# Altium project MVP-Dash-v1.0.PrjPcb (part 2 of 15)

## Sheet Power-PMIC-Sheet.SchDoc
size 420 x 297 mm; SheetNumber: 2; SheetTotal: 25
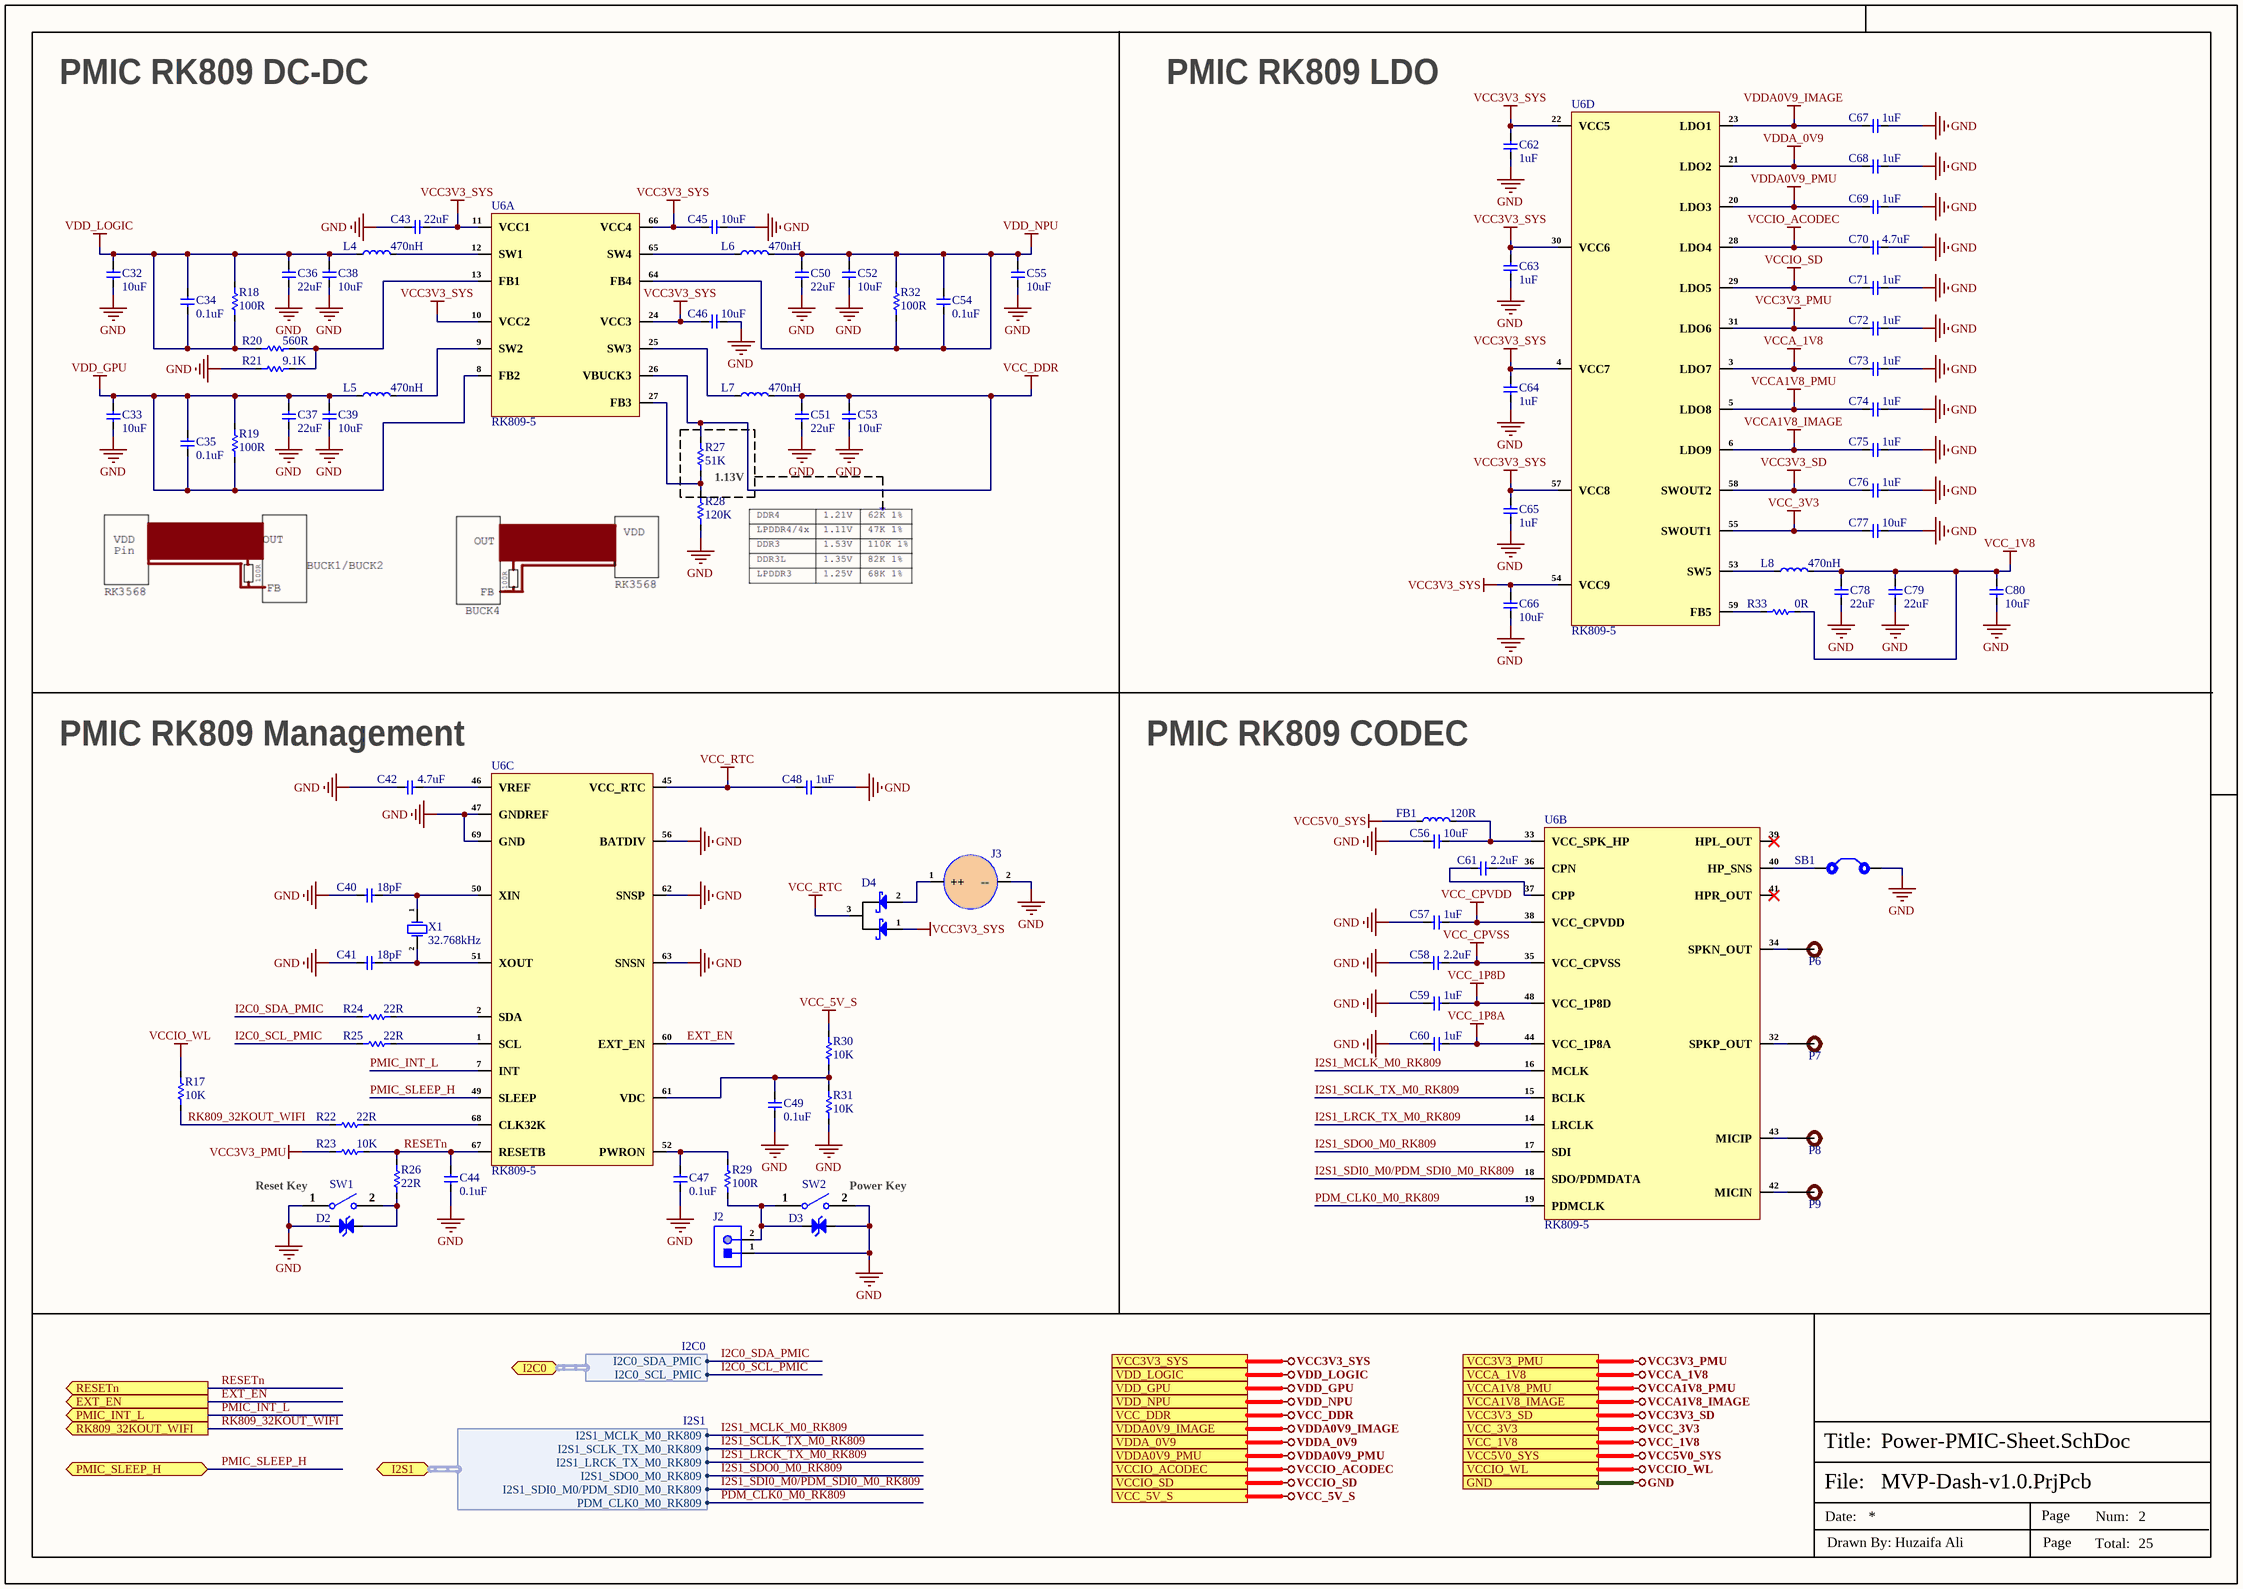
[diagram p1: Power-PMIC-Sheet.SchDoc]

### Parts
C32  10uF  [Cap-0603]
C33  10uF  [Cap-0603]
C34  0.1uF  [Cap-0402]
C35  0.1uF  [Cap-0402]
C36  22uF  [Cap-0603]
C37  22uF  [Cap-0603]
C38  10uF  [Cap-0603]
C39  10uF  [Cap-0603]
C40  18pF  [Cap-0402]
C41  18pF  [Cap-0402]
C42  4.7uF  [Cap-0402]
C43  22uF  [Cap-0603]
C44  0.1uF  [Cap-0402]
C45  10uF  [Cap-0603]
C46  10uF  [Cap-0603]
C47  0.1uF  [Cap-0402]
C48  1uF  [Cap-0402]
C49  0.1uF  [Cap-0402]
C50  22uF  [Cap-0603]
C51  22uF  [Cap-0603]
C52  10uF  [Cap-0603]
C53  10uF  [Cap-0603]
C54  0.1uF  [Cap-0402]
C55  10uF  [Cap-0603]
C56  10uF  [Cap-0603]
C57  1uF  [Cap-0402]
C58  2.2uF  [Cap-0402]
C59  1uF  [Cap-0402]
C60  1uF  [Cap-0402]
C61  2.2uF  [Cap-0402]
C62  1uF  [Cap-0402]
C63  1uF  [Cap-0402]
C64  1uF  [Cap-0402]
C65  1uF  [Cap-0402]
C66  10uF  [Cap-0603]
C67  1uF  [Cap-0402]
C68  1uF  [Cap-0402]
C69  1uF  [Cap-0402]
C70  4.7uF  [Cap-0402]
C71  1uF  [Cap-0402]
C72  1uF  [Cap-0402]
C73  1uF  [Cap-0402]
C74  1uF  [Cap-0402]
C75  1uF  [Cap-0402]
C76  1uF  [Cap-0402]
C77  10uF  [Cap-0603]
C78  22uF  [Cap-0603]
C79  22uF  [Cap-0603]
C80  10uF  [Cap-0603]
D2  ESD5451N  [DFN1006-2L (Bi-Directional)]  (value not drawn)
D3  ESD5451N  [DFN1006-2L (Bi-Directional)]  (value not drawn)
D4  BAT54C  [SOT-23]  (value not drawn)
FB1  120R  [IND-0603 (1608 Metric)]
J2  X6511WV-02H-C60D30  [HDR1X2_]  (value not drawn)
J3  CR2032-BS-6-1  [CR2032-BS-6-1]  (value not drawn)
L4  470nH  [YHNR3012-R47M]
L5  470nH  [YHNR3012-R47M]
L6  470nH  [YHNR3012-R47M]
L7  470nH  [YHNR3012-R47M]
L8  470nH  [YHNR3012-R47M]
P6  TEST POINT 0.5mm Dia  [Test-point - 0.5mm]  (value not drawn)  (no BOM)
P7  TEST POINT 0.5mm Dia  [Test-point - 0.5mm]  (value not drawn)  (no BOM)
P8  TEST POINT 0.5mm Dia  [Test-point - 0.5mm]  (value not drawn)  (no BOM)
P9  TEST POINT 0.5mm Dia  [Test-point - 0.5mm]  (value not drawn)  (no BOM)
R17  10K  [Res-0402]
R18  100R  [Res-0402]
R19  100R  [Res-0402]
R20  560R  [Res-0402]
R21  9.1K  [Res-0402]
R22  22R  [Res-0402]
R23  10K  [Res-0402]
R24  22R  [Res-0402]
R25  22R  [Res-0402]
R26  22R  [Res-0402]
R27  51K  [Res-0402]
R28  120K  [Res-0402]
R29  100R  [Res-0402]
R30  10K  [Res-0402]
R31  10K  [Res-0402]
R32  100R  [Res-0402]
R33  0R  [Res-0402]
SB1  Solder Bridge 0402  [Solder Bridge 0402]  (value not drawn)  (no BOM)
SW1  B3U-1000P  [B3U-1000P]  (value not drawn)
SW2  B3U-1000P  [B3U-1000P]  (value not drawn)
U6  RK809-5  [68-QFN-(7x7)]  (parts A,B,C,D of 4)
X1  32.768kHz  [SMD3215-2P]

### Blocks framed on the sheet
1.13V: R27

### Ports
EXT_EN (out, see Power-DC-IN-Sheet[1D]), GND (see CAN-Bus-SPI-Flash-Sheet[4D], Connector-Sheet[5D], DRAM-LPDDR4x-Sheet[4D], eMMC-Sheet[4D], LED-Debug-Sheet[4D], Power-DC-IN-Sheet[4D], Power-Others-Sheet[4D], RK3568-Audio-Interface[4D], RK3568-Flash-SD-Controller[4D], RK3568-OSC-PMUIO-Sheet[5D], RK3568-Power-Sheet[4D], RK3568-SARADC-GPIO[4D], RK3568-USB-PCIe-Sheet[5D], RK3568-VI-Interface-Sheet[4D], RK3568-VO-Interface-1[4D], RK3568-VO-Interface-2[4D], Sensors-Sheet-1[4D], Sensors-Sheet-2[5D], Type-C-Sheet[4D], USB-Ports[4D], VO-HDMI2.0-TX-Sheet[4D], VO-LCM-MIPI-DSI-TX0[4D], WIFI-BT-SDIO-Sheet[4D]), I2C0 (bidir, harness I2C0, see Power-Others-Sheet[3D], RK3568-OSC-PMUIO-Sheet[3D], Type-C-Sheet[2D]), I2S1 (bidir, harness I2S1, see RK3568-Audio-Interface[1D]), PMIC_INT_L (out, see RK3568-OSC-PMUIO-Sheet[5B]), PMIC_SLEEP_H (bidir, see Power-Others-Sheet[1D], RK3568-OSC-PMUIO-Sheet[5B]), RESETn (out, see RK3568-OSC-PMUIO-Sheet[5A]), RK809_32KOUT_WIFI (out, see WIFI-BT-SDIO-Sheet[3D]), VCC3V3_PMU (see Power-Others-Sheet[4D], RK3568-OSC-PMUIO-Sheet[5D], Type-C-Sheet[4D]), VCC3V3_SD (see CAN-Bus-SPI-Flash-Sheet[4D]), VCC3V3_SYS (see DRAM-LPDDR4x-Sheet[4D], Power-DC-IN-Sheet[4D], RK3568-SARADC-GPIO[4D]), VCC5V0_SYS (see Power-DC-IN-Sheet[4D], Power-Others-Sheet[4D], Sensors-Sheet-1[4D], VO-HDMI2.0-TX-Sheet[4D], VO-LCM-MIPI-DSI-TX0[4D]), VCC_1V8 (see Power-Others-Sheet[4D], RK3568-SARADC-GPIO[4D], RK3568-VI-Interface-Sheet[4D], WIFI-BT-SDIO-Sheet[4D]), VCC_3V3 (see eMMC-Sheet[4D], RK3568-SARADC-GPIO[4D], RK3568-USB-PCIe-Sheet[5D], RK3568-VO-Interface-2[4D], VO-HDMI2.0-TX-Sheet[4D], WIFI-BT-SDIO-Sheet[4D]), VCC_5V_S (see Power-DC-IN-Sheet[4D]), VCC_DDR (see DRAM-LPDDR4x-Sheet[4D]), VCCA1V8_IMAGE (see RK3568-VI-Interface-Sheet[4D], RK3568-VO-Interface-1[4D]), VCCA1V8_PMU (see DRAM-LPDDR4x-Sheet[4D], RK3568-OSC-PMUIO-Sheet[5D]), VCCA_1V8 (see LED-Debug-Sheet[4D], RK3568-OSC-PMUIO-Sheet[5D], RK3568-SARADC-GPIO[4D], RK3568-USB-PCIe-Sheet[5D]), VCCIO_ACODEC, VCCIO_SD (see RK3568-Flash-SD-Controller[4D]), VCCIO_WL, VDD_GPU (see RK3568-Power-Sheet[4D]), VDD_LOGIC (see RK3568-Power-Sheet[4D]), VDD_NPU (see RK3568-Power-Sheet[4D]), VDDA0V9_IMAGE (see RK3568-VI-Interface-Sheet[4D], RK3568-VO-Interface-1[4D]), VDDA0V9_PMU (see RK3568-OSC-PMUIO-Sheet[5D]), VDDA_0V9 (see RK3568-OSC-PMUIO-Sheet[5D], RK3568-USB-PCIe-Sheet[5D])

### Harnesses
I2S1: I2S1_MCLK_M0_RK809, I2S1_SCLK_TX_M0_RK809, I2S1_LRCK_TX_M0_RK809, I2S1_SDO0_M0_RK809, I2S1_SDI0_M0/PDM_SDI0_M0_RK809, PDM_CLK0_M0_RK809
I2C0: I2C0_SDA_PMIC, I2C0_SCL_PMIC

### Nets
GND: C32.1 C33.1 C36.1 C37.1 C38.1 C39.1 C40.1 C41.1 C42.1 C43.2 C44.1 C45.1 C46.1 C47.1 C48.1 C49.1 C50.1 C51.1 C52.1 C53.1 C55.1 C56.2 C57.2 C58.1 C59.2 C60.2 C62.1 C63.1 C64.1 C65.1 C66.1 C67.1 C68.1 C69.1 C70.1 C71.1 C72.1 C73.1 C74.1 C75.1 C76.1 C77.1 C78.1 C79.1 C80.1 D2.1(K) D3.2(K) J2.1 J3.2(--) R21.1 R28.1 R31.1 SB1.2 SW1.1 SW2.2 U6.47(GNDREF) U6.56(BATDIV) U6.62(SNSP) U6.63(SNSN) U6.69(GND) ; port GND
VCC3V3_PMU: C72.2 R23.2 U6.31(LDO6) ; port VCC3V3_PMU
VCC3V3_SD: C76.2 U6.58(SWOUT2) ; port VCC3V3_SD
VCC3V3_SYS: C43.1 C45.2 C46.2 C62.2 C63.2 C64.2 C65.2 C66.2 D4.1(A) U6.4(VCC7) U6.10(VCC2) U6.11(VCC1) U6.22(VCC5) U6.24(VCC3) U6.30(VCC6) U6.54(VCC9) U6.57(VCC8) U6.66(VCC4) ; port VCC3V3_SYS
VCC5V0_SYS: FB1.1 ; port VCC5V0_SYS
VCC_1P8A: C60.1 U6.44(VCC_1P8A)
VCC_1P8D: C59.1 U6.48(VCC_1P8D)
VCC_1V8: C78.2 C79.2 C80.2 L8.2 R33.2 ; port VCC_1V8
VCC_3V3: C77.2 U6.55(SWOUT1) ; port VCC_3V3
VCC_5V_S: R30.2 ; port VCC_5V_S
VCC_CPVDD: C57.1 U6.38(VCC_CPVDD)
VCC_CPVSS: C58.2 U6.35(VCC_CPVSS)
VCC_DDR: C51.2 C53.2 L7.2 R27.2 U6.26(VBUCK3) ; port VCC_DDR
VCC_RTC: C48.2 D4.3(K) U6.45(VCC_RTC)
VCCA1V8_IMAGE: C75.2 U6.6(LDO9) ; port VCCA1V8_IMAGE
VCCA1V8_PMU: C74.2 U6.5(LDO8) ; port VCCA1V8_PMU
VCCA_1V8: C73.2 U6.3(LDO7) ; port VCCA_1V8
VCCIO_ACODEC: C70.2 U6.28(LDO4) ; port VCCIO_ACODEC
VCCIO_SD: C71.2 U6.29(LDO5) ; port VCCIO_SD
VCCIO_WL: R17.1 ; port VCCIO_WL
VDD_GPU: C33.2 C35.1 C35.2 C37.2 C39.2 L5.1 R19.1 R19.2 U6.8(FB2) ; port VDD_GPU
VDD_LOGIC: C32.2 C34.1 C34.2 C36.2 C38.2 L4.1 R18.1 R18.2 R20.1 ; port VDD_LOGIC
VDD_NPU: C50.2 C52.2 C54.1 C54.2 C55.2 L6.2 R32.1 R32.2 U6.64(FB4) ; port VDD_NPU
VDDA0V9_IMAGE: C67.2 U6.23(LDO1) ; port VDDA0V9_IMAGE
VDDA0V9_PMU: C69.2 U6.20(LDO3) ; port VDDA0V9_PMU
VDDA_0V9: C68.2 U6.21(LDO2) ; port VDDA_0V9
EXT_EN: U6.60(EXT_EN) ; port EXT_EN
I2C0_SCL_PMIC: R25.2 ; port I2C0.I2C0_SCL_PMIC
I2C0_SDA_PMIC: R24.2 ; port I2C0.I2C0_SDA_PMIC
I2S1_LRCK_TX_M0_RK809: U6.14(LRCLK) ; port I2S1.I2S1_LRCK_TX_M0_RK809
I2S1_MCLK_M0_RK809: U6.16(MCLK) ; port I2S1.I2S1_MCLK_M0_RK809
I2S1_SCLK_TX_M0_RK809: U6.15(BCLK) ; port I2S1.I2S1_SCLK_TX_M0_RK809
I2S1_SDI0_M0/PDM_SDI0_M0_RK809: U6.18(SDO/PDMDATA) ; port I2S1.I2S1_SDI0_M0/PDM_SDI0_M0_RK809
I2S1_SDO0_M0_RK809: U6.17(SDI) ; port I2S1.I2S1_SDO0_M0_RK809
PDM_CLK0_M0_RK809: U6.19(PDMCLK) ; port I2S1.PDM_CLK0_M0_RK809
PMIC_INT_L: U6.7(INT) ; port PMIC_INT_L
PMIC_SLEEP_H: U6.49(SLEEP) ; port PMIC_SLEEP_H
RESETn: C44.2 R23.1 R26.2 U6.67(RESETB) ; port RESETn
RK809_32KOUT_WIFI: R17.2 R22.2 ; port RK809_32KOUT_WIFI
NetC40_2: C40.2 U6.50(XIN) X1.1(OSC1)
NetC41_2: C41.2 U6.51(XOUT) X1.2(OSC2)
NetC42_2: C42.2 U6.46(VREF)
NetC47_2: C47.2 R29.2 U6.52(PWRON)
NetC49_2: C49.2 R30.1 R31.2 U6.61(VDC)
NetC56_1: C56.1 FB1.2 U6.33(VCC_SPK_HP)
NetC61_1: C61.1 U6.37(CPP)
NetC61_2: C61.2 U6.36(CPN)
NetD2_2: D2.2(K) R26.1 SW1.2
NetD3_1: D3.1(K) J2.2 R29.1 SW2.1
NetD4_2: D4.2(A) J3.1(++)
NetL4_2: L4.2 U6.12(SW1)
NetL5_2: L5.2 U6.9(SW2)
NetL6_1: L6.1 U6.65(SW4)
NetL7_1: L7.1 U6.25(SW3)
NetL8_1: L8.1 U6.53(SW5)
NetP6_1: P6.1 U6.34(SPKN_OUT)
NetP7_1: P7.1 U6.32(SPKP_OUT)
NetP8_1: P8.1 U6.43(MICIP)
NetP9_1: P9.1 U6.42(MICIN)
NetR20_2: R20.2 R21.2 U6.13(FB1)
NetR22_1: R22.1 U6.68(CLK32K)
NetR24_1: R24.1 U6.2(SDA)
NetR25_1: R25.1 U6.1(SCL)
NetR27_1: R27.1 R28.2 U6.27(FB3)
NetR33_1: R33.1 U6.59(FB5)
NetSB1_1: SB1.1 U6.40(HP_SNS)

Not connected (* = marked no-connect by the designer): U6 39(HPL_OUT)* 41(HPR_OUT)*

### Notes on the sheet
- PMIC RK809 DC-DC
- PMIC RK809 LDO
- (near C42) PMIC RK809 Management
- PMIC RK809 CODEC
- Reset Key
- (near SW2) Power Key
- File:
- Title:
- Date:
- Page
- Num:
- Total:
- Drawn By: Huzaifa Ali

### Library data of the parts
C32 C33 C38 C39 C45 C46 C52 C53 C55 C56 C66 C77 C80 = CC0603KRX5R6BB106: CAP CER 10UF 10V X5R 0603; Manufacturer: Yageo; Tolerance: 10%; Item Type: Capacitor; Supplier 1: Digi-Key; Manufacturer Part Number: CC0603KRX5R6BB106; RoHS: Yes; Category: Ceramic Capacitors; Stock 1: 187515; Pricing 1: 1=0.24000, 10=0.16300, 50=0.09780, 100=0.08260, 500=0.05654, 1000=0.05001 (USD); Mount: Surface Mount; Case/Package: 0603; Case Code (Metric): 1608; Case Code (Imperial): 0603; Weight: 7.1E-05oz; Min Operating Temperature: -55°C; Max Operating Temperature: 85°C; Capacitance: 10uF; Packaging: Tape and Reel; Dielectric: X5R; Voltage Rating: 10V; Termination: SMD/SMT; Resistor Type: Ceramic; Voltage Rating (DC): 10V; Package Quantity: 4000; Length: 0.063inch; Width: 0.031inch; Thickness: 0.035inch; Depth: 0.8mm; Lead Free: Lead Free; Halogen Free: Halogen Free; RoHS Compliant: Yes; ComponentLink1URL: http://www.mouser.com/ds/2/447/Yageo_UPY-GP_NP0_16V-to-50V_9-358835.pdf?src-supplier=Mouser; ComponentLink1Description: http://www.mouser.com/ds/2/447/Yageo_UPY-GP_NP0_16V-to-50V_9-358835.pdf?src-supplier=Mouser; ComponentLink2URL: http://www.yageo.com/documents/recent/UPY-GPHC_X5R_4V-to-50V_25.pdf?src-supplier=Digi-Key; ComponentLink2Description: http://www.yageo.com/documents/recent/UPY-GPHC_X5R_4V-to-50V_25.pdf?src-supplier=Digi-Key; Supplier Part Number 1: 311-1782-1-ND; LCSC Part Number: C326057
C34 C35 C44 C47 C49 C54 = CC0402KRX5R6BB104: CAP CER 0.1UF 10V X5R 0402; Manufacturer: Yageo; Capacitance: 100nF; Tolerance: 10%; Dissipation Factor: 5%; Insulation Resistance: 10GR; Item Type: Capacitor; Supplier 1: Digi-Key; Manufacturer Part Number: CC0402KRX5R6BB104; RoHS: Yes; Category: Ceramic Capacitors; Stock 1: 6385580; Pricing 1: 1=0.10000, 10=0.02700, 50=0.01500, 100=0.01220, 500=0.00874, 1000=0.00687, 2500=0.00625, 5000=0.00575 (USD); Mount: Surface Mount; Case/Package: 0402; Number of Pins: 2; Case Code (Imperial): 0402; Case Code (Metric): 1005; Min Operating Temperature: -55°C; Max Operating Temperature: 85°C; Dielectric: X5R; Packaging: Tape and Reel; Voltage Rating: 10V; Package Quantity: 1; Termination: SMD/SMT; Voltage Rating (DC): 10V; Series: CC; Length: 1mm; Width: 0.02inch; Height: 0.5mm; Depth: 0.5mm; Thickness: 0.022inch; Radiation Hardening: No; RoHS Compliant: Yes; REACH SVHC: No SVHC; Lead Free: Lead Free; Halogen Free: Halogen Free; ComponentLink1URL: https://datasheet.ciiva.com/144/mlccorderingcode-144029.pdf?src-supplier=Digi-Key; ComponentLink1Description: https://datasheet.ciiva.com/144/mlccorderingcode-144029.pdf?src-supplier=Digi-Key; ComponentLink2URL: https://datasheet.ciiva.com/144/mlccorderingcode-144028.pdf?src-supplier=Digi-Key; ComponentLink2Description: https://datasheet.ciiva.com/144/mlccorderingcode-144028.pdf?src-supplier=Digi-Key; ComponentLink3URL: https://datasheet.ciiva.com/144/mlccorderingcode-144030.pdf?src-supplier=Digi-Key; ComponentLink3Description: https://datasheet.ciiva.com/144/mlccorderingcode-144030.pdf?src-supplier=Digi-Key; ComponentLink4URL: https://datasheet.ciiva.com/7978/1359354-7978091.pdf?src-supplier=Element14; ComponentLink4Description: https://datasheet.ciiva.com/7978/1359354-7978091.pdf?src-supplier=Element14; ComponentLink5URL: https://datasheet.ciiva.com/11587/upy-gphc-x5r-4v-to-50v-12-11587302.pdf?src-supplier=Avnet; ComponentLink5Description: https://datasheet.ciiva.com/11587/upy-gphc-x5r-4v-to-50v-12-11587302.pdf?src-supplier=Avnet; Supplier Part Number 1: 311-1336-1-ND; LCSC Part Number: C129131
C36 C37 C50 C51 C78 C79 = CC0603MRX5R5BB226: CAP CER 22UF 6.3V X5R 0603; Manufacturer: Yageo; Tolerance: 20%; Supplier 1: Mouser; Manufacturer Part Number: CC0603MRX5R5BB226; RoHS: Yes; Category: Ceramic Capacitors; Stock 1: 3030; Pricing 1: 1=0.33000, 10=0.22500, 50=0.22500, 100=0.12800, 1000=0.07900, 10000=0.06500 (USD); Mount: Surface Mount; Case/Package: 0603; Case Code (Metric): 1608; Case Code (Imperial): 0603; Weight: 7.1E-05oz; Min Operating Temperature: -55°C; Max Operating Temperature: 85°C; Capacitance: 22uF; Packaging: Tape and Reel; Dielectric: X5R; Voltage Rating: 6.3V; Termination: SMD/SMT; Resistor Type: Ceramic; Voltage Rating (DC): 6.3V; Package Quantity: 4000; Length: 0.063inch; Width: 0.031inch; Thickness: 0.035inch; Depth: 0.8mm; Lead Free: Lead Free; Halogen Free: Halogen Free; RoHS Compliant: Yes; ComponentLink1URL: http://www.mouser.com/ds/2/447/Yageo_UPY-GP_NP0_16V-to-50V_9-358835.pdf?src-supplier=Mouser; ComponentLink1Description: http://www.mouser.com/ds/2/447/Yageo_UPY-GP_NP0_16V-to-50V_9-358835.pdf?src-supplier=Mouser; ComponentLink2URL: http://www.yageo.com/documents/recent/UPY-GPHC_X5R_4V-to-50V_25.pdf?src-supplier=Digi-Key; ComponentLink2Description: http://www.yageo.com/documents/recent/UPY-GPHC_X5R_4V-to-50V_25.pdf?src-supplier=Digi-Key; Supplier Part Number 1: 603-CC603MRX5R5BB226; LCSC Part Number: C109448
C40 C41 = GCM1555C1H180GA16D: CAP CER 18PF 50V C0G/NP0 0402; Manufacturer: Murata; Tolerance: 2%; Item Type: Capacitor; Supplier: Rs; Supplier Part Number: 2477793P; Manufacturer Part Number: GCM1555C1H180GA16D; RoHS: Yes; Category: Ceramic Capacitors; Stock: 10000; Pricing: 500=0.013, 5000=0.009 (GBP); Mounting Technology: Surface Mount; Case/Package: 0402; Case Code (Imperial): 0402; Case Code (Metric): 1005; Min Operating Temperature: -55°C; Max Operating Temperature: 125°C; Packaging: Cut Tape; Value: 18pF; Voltage Rating: 50V; Series: GCM; Ratings: AEC-Q200; RoHS Compliant: Yes; ComponentLink1URL: http://search.murata.co.jp/Ceramy/image/img/A01X/G101/ENG/GCM1555C1H180GA16-01.pdf?src-supplier=Digi-Key; ComponentLink1Description: http://search.murata.co.jp/Ceramy/image/img/A01X/G101/ENG/GCM1555C1H180GA16-01.pdf?src-supplier=Digi-Key; ComponentLink2URL: https://search.murata.co.jp/Ceramy/image/img/A01X/G101/ENG/GCM1555C1H180GA16-01.pdf?src-supplier=Digi-Key; ComponentLink2Description: https://search.murata.co.jp/Ceramy/image/img/A01X/G101/ENG/GCM1555C1H180GA16-01.pdf?src-supplier=Digi-Key; ComponentLink3URL: https://datasheet.octopart.com/GCM1555C1H180GA16D-Murata-datasheet-149522315.pdf?src-supplier=Newark; ComponentLink3Description: https://datasheet.octopart.com/GCM1555C1H180GA16D-Murata-datasheet-149522315.pdf?src-supplier=Newark; ComponentLink4URL: https://datasheet.octopart.com/GCM1555C1H180GA16D-Murata-datasheet-12511495.pdf?src-supplier=TME; ComponentLink4Description: https://datasheet.octopart.com/GCM1555C1H180GA16D-Murata-datasheet-12511495.pdf?src-supplier=TME; LCSC Part Number: C882583
C42 = CC0402KRX5R6BB475: CAP CER 4.7UF 10V X5R 0402; Manufacturer: Yageo; Tolerance: 10%; Supplier 1: Farnell; Manufacturer Part Number: CC0402KRX5R6BB475; RoHS: Yes; Category: Ceramic Capacitors; Stock 1: 20000; Pricing 1: 10000=0.02310, 50000=0.02100 (GBP); Mount: Surface Mount; Case/Package: 0402; Case Code (Imperial): 0402; Case Code (Metric): 1005; Min Operating Temperature: -55°C; Max Operating Temperature: 85°C; Packaging: Cut Tape; Capacitance: 4.7uF; Voltage Rating: 10V; RoHS Compliant: Yes; ComponentLink1URL: http://www.yageo.com/documents/recent/UPY-GPHC_X5R_4V-to-50V_25.pdf?src-supplier=Digi-Key; ComponentLink1Description: http://www.yageo.com/documents/recent/UPY-GPHC_X5R_4V-to-50V_25.pdf?src-supplier=Digi-Key; Supplier Part Number 1: 3871698; LCSC Part Number: C326586
C43 = CC0603MRX5R6BB226: CAP CER 22UF 10V X5R 0603; Manufacturer: Yageo; Tolerance: 20%; Item Type: Capacitor; Supplier 1: Digi-Key; Manufacturer Part Number: CC0603MRX5R6BB226; RoHS: Yes; Category: Ceramic Capacitors; Stock 1: 19628; Pricing 1: 1=0.68000, 10=0.48000, 50=0.36300, 100=0.31610, 500=0.23416, 1000=0.19903 (USD); Mount: Surface Mount; Case/Package: 0603; Case Code (Metric): 1608; Case Code (Imperial): 0603; Weight: 7.1E-05oz; Min Operating Temperature: -55°C; Max Operating Temperature: 85°C; Packaging: Tape and Reel; Capacitance: 22uF; Voltage Rating: 10V; Dielectric: X5R; Termination: SMD/SMT; Voltage Rating (DC): 10V; Package Quantity: 4000; Length: 0.063inch; Width: 0.8mm; Height: 0.8mm; Thickness: 0.035inch; Lead Free: Lead Free; Halogen Free: Halogen Free; RoHS Compliant: Yes; ComponentLink1URL: http://www.mouser.com/ds/2/447/Yageo_UPY-GP_NP0_16V-to-50V_9-358835.pdf?src-supplier=Mouser; ComponentLink1Description: http://www.mouser.com/ds/2/447/Yageo_UPY-GP_NP0_16V-to-50V_9-358835.pdf?src-supplier=Mouser; ComponentLink2URL: http://www.yageo.com/documents/recent/UPY-GPHC_X5R_4V-to-50V_25.pdf?src-supplier=Digi-Key; ComponentLink2Description: http://www.yageo.com/documents/recent/UPY-GPHC_X5R_4V-to-50V_25.pdf?src-supplier=Digi-Key; Supplier Part Number 1: 311-1819-1-ND; LCSC Part Number: C109447
C48 C57 C59 C60 C62-C65 C67-C69 C71-C76 = CC0402KRX5R6BB105: CAP CER 1UF 10V X5R 0402; Manufacturer: Yageo; Tolerance: 10%; Dissipation Factor: 15%; Item Type: Capacitor; Supplier 1: Mouser; Manufacturer Part Number: CC0402KRX5R6BB105; RoHS: Yes; Category: Ceramic Capacitors; Stock 1: 6711367; Pricing 1: 1=0.11000, 10=0.05500, 50=0.05500, 100=0.03300, 500=0.02700, 1000=0.02200, 2500=0.02100, 10000=0.01800 (USD); Mount: Surface Mount; Case/Package: 0402; Number of Pins: 2; Case Code (Metric): 1005; Case Code (Imperial): 0402; Min Operating Temperature: -55°C; Max Operating Temperature: 85°C; Capacitance: 1uF; Dielectric: X5R; Package Quantity: 1; Voltage Rating: 10V; Packaging: Tape and Reel; Voltage Rating (DC): 10V; Termination: SMD/SMT; Resistor Type: Ceramic; Series: CC; Construction: Flat; Length: 1mm; Width: 0.02inch; Height: 0.5mm; Thickness: 0.022inch; Depth: 0.5mm; Radiation Hardening: No; REACH SVHC: No SVHC; Lead Free: Lead Free; Halogen Free: Halogen Free; RoHS Compliant: Yes; ComponentLink1URL: https://datasheet.ciiva.com/176/upy-gphc-x5r-4v-to-50v-12-176704.pdf?src-supplier=Digi-Key; ComponentLink1Description: https://datasheet.ciiva.com/176/upy-gphc-x5r-4v-to-50v-12-176704.pdf?src-supplier=Digi-Key; ComponentLink2URL: https://datasheet.ciiva.com/176/mlccorderingcode-176705.pdf?src-supplier=Digi-Key; ComponentLink2Description: https://datasheet.ciiva.com/176/mlccorderingcode-176705.pdf?src-supplier=Digi-Key; ComponentLink3URL: https://datasheet.ciiva.com/176/mlccorderingcode-176706.pdf?src-supplier=Digi-Key; ComponentLink3Description: https://datasheet.ciiva.com/176/mlccorderingcode-176706.pdf?src-supplier=Digi-Key; Supplier Part Number 1: 603-CC402KRX5R6BB105; LCSC Part Number: C106254
C58 C61 = C1005X5R0J225KTJA0E: CAP CER 2.2UF 6.3V X5R 0402; Manufacturer: TDK; Item Type: Capacitor; LCSC Part Number: C343036; Manufacturer Part Number: C1005X5R0J225KTJA0E; ComponentLink1Description: LCSC; ComponentLink1URL: https://www.lcsc.com/product-detail/Multilayer-Ceramic-Capacitors-MLCC-SMD-SMT_TDK-C1005X5R0J225KTJA0E_C343036.html
C70 = CC0402KRX5R5BB475: CAP CER 4.7UF 6.3V X5R 0402; Manufacturer: Yageo; Tolerance: 10%; Item Type: Capacitor; Supplier 1: Arrow Electronics; Manufacturer Part Number: CC0402KRX5R5BB475; RoHS: Yes; Category: Ceramic Capacitors; Stock 1: 890000; Pricing 1: 10000=0.02120, 20000=0.02030, 30000=0.02010, 50000=0.01930, 100000=0.01760, 250000=0.01630 (USD); Case/Package: 0402; Voltage Rating (DC): 6.3V; Dielectric: X5R; Capacitance: 4.7uF; Lead Free: Lead Free; Halogen Free: Halogen Free; RoHS Compliant: Yes; ComponentLink1URL: http://www.yageo.com/documents/recent/UPY-GPHC_X5R_4V-to-50V_25.pdf?src-supplier=Digi-Key; ComponentLink1Description: http://www.yageo.com/documents/recent/UPY-GPHC_X5R_4V-to-50V_25.pdf?src-supplier=Digi-Key; ComponentLink2URL: https://www.yageo.com/upload/media/product/productsearch/datasheet/mlcc/UPY-GPHC_X5R_4V-to-50V_26.pdf?src-supplier=Digi-Key; ComponentLink2Description: https://www.yageo.com/upload/media/product/productsearch/datasheet/mlcc/UPY-GPHC_X5R_4V-to-50V_26.pdf?src-supplier=Digi-Key; LCSC Part Number: C541466; Supplier Part Number 1: CC0402KRX5R5BB475
D2 D3 = ESD5451N: DFN1006-2(0402) ESD Protection Devices ROHS; Manufacturer: TECH PUBLIC; Manufacturer Part Number: ESD5451N; Footprint: DFN1006-2(0402); ComponentLink1Description: LCSC; ComponentLink1URL: https://www.lcsc.com/product-detail/span-style-background-color-ff0-ESD-span-Protection-Devices_TECH-PUBLIC-ESD5451N_C2936977.html; LCSC Part Number: C2936977
D4 = BAT54C: 30V Dual Common Cathode 1V@100mA 200mA SOT-23(TO-236) Schottky Barrier Diodes (SBD) ROHS; Manufacturer: Shandong Jingdao Microelectronics; Item Type: Diode; Manufacturer Part Number: BAT54C; LCSC Part Number: C2762215; ComponentLink1Description: LCSC; ComponentLink1URL: https://www.lcsc.com/product-detail/Schottky-Barrier-Diodes-SBD_Shandong-Jingdao-Microelectronics-BAT54C_C2762215.html; Package: SOT-23(TO-236)
FB1 = BLM18PG121SN1D: Ferrite Beads Multi-Layer 120Ohm 25% 100MHz 2A 50mOhm DCR 0603 Paper T/R; Manufacturer: Murata Electronics; Material: Steel,Ferrite; Number of Lines: 1; DC Resistance (DCR): 50mR; Shielding: Unshielded; Manufacturer Part Number: BLM18PG121SN1D; Package: 0603; LCSC Part Number: C14709; Item Type: Ferrite Bead; ComponentLink1Description: LCSC; ComponentLink1URL: https://www.lcsc.com/product-detail/Ferrite-Beads_Murata-Electronics-BLM18PG121SN1D_C14709.html; Supplier: Digikey; Supplier Part Number: 490-1037-1-ND; RoHS: Yes; Category: Ferrite Beads and Chips; Stock: 1240; Pricing: 1=0.1, 10=0.078, 25=0.0712, 50=0.064, 100=0.0469, 250=0.03412, 500=0.03128, 1000=0.02701 (USD); Case/Package: 0603; Pins: 2; Core Material: Ferrite; Case Code (Metric): 1608; Case Code (Imperial): 0603; Min Operating Temperature: -55°C; Max Operating Temperature: 125°C; Tolerance: 25%; Impedance: 120R; Package Quantity: 1; Max Current Rating: 2A; Packaging: Tape and Reel; Current Rating: 2A; Max DC Current: 2A; Termination: SMD/SMT; Test Frequency: 100MHz; DC Current: 2A; Frequency: 100MHz; Number of Circuits: 1; Series: BLM18P; DC Resistance-Max: 50mR; RMS Current (Irms): 2A; ESR: 50mR; Length: 1.6mm; Width: 0.8mm; Height: 0.8mm; Depth: 0.8mm; Radiation Hardening: No; Reach SVHC Compliant: No; Lead Free: Lead Free; RoHS Compliant: Yes; ComponentLink2URL: https://datasheet.ciiva.com/5709/1740433-5709171.pdf?src-supplier=Farnell; ComponentLink2Description: https://datasheet.ciiva.com/5709/1740433-5709171.pdf?src-supplier=Farnell; ComponentLink3URL: https://datasheet.ciiva.com/19454/1845013-19454715.pdf?src-supplier=Jameco; ComponentLink3Description: https://datasheet.ciiva.com/19454/1845013-19454715.pdf?src-supplier=Jameco; ComponentLink4URL: https://datasheet.ciiva.com/11799/0900766b81275ca5-11799546.pdf?src-supplier=Rs; ComponentLink4Description: https://datasheet.ciiva.com/11799/0900766b81275ca5-11799546.pdf?src-supplier=Rs; ComponentLink5URL: https://datasheet.ciiva.com/3854/5emiapbde-1-3854039.pdf?src-supplier=Arrow+Electronics; ComponentLink5Description: https://datasheet.ciiva.com/3854/5emiapbde-1-3854039.pdf?src-supplier=Arrow+Electronics; ComponentLink6URL: https://datasheet.ciiva.com/29347/442365-da-01-en-chip-drossel-0603-120r-2000ma-1-6x0-8mm-29347911.pdf?src-supplier=Conrad; ComponentLink6Description: https://datasheet.ciiva.com/29347/442365-da-01-en-chip-drossel-0603-120r-2000ma-1-6x0-8mm-29347911.pdf?src-supplier=Conrad; ComponentLink7URL: https://datasheet.ciiva.com/8021/1740433-8021493.pdf?src-supplier=Element14; ComponentLink7Description: https://datasheet.ciiva.com/8021/1740433-8021493.pdf?src-supplier=Element14; ComponentLink8URL: https://datasheet.ciiva.com/8021/1740433-8021494.pdf?src-supplier=Element14; ComponentLink8Description: https://datasheet.ciiva.com/8021/1740433-8021494.pdf?src-supplier=Element14; ComponentLink9URL: https://datasheet.ciiva.com/14122/blm-series-eng-tds-14122905.pdf?src-supplier=Distrelec; ComponentLink9Description: https://datasheet.ciiva.com/14122/blm-series-eng-tds-14122905.pdf?src-supplier=Distrelec; ComponentLink10URL: https://datasheet.ciiva.com/6212/l0110s0100blm18p-6212502.pdf?src-supplier=Digikey; ComponentLink10Description: https://datasheet.ciiva.com/6212/l0110s0100blm18p-6212502.pdf?src-supplier=Digikey; ComponentLink11URL: https://datasheet.ciiva.com/6212/l0110s0100blm18p-6212504.pdf?src-supplier=Digikey; ComponentLink11Description: https://datasheet.ciiva.com/6212/l0110s0100blm18p-6212504.pdf?src-supplier=Digikey; ComponentLink12URL: https://datasheet.ciiva.com/3081/l0110s0100blm18p-3081632.pdf?src-supplier=Avnet; ComponentLink12Description: https://datasheet.ciiva.com/3081/l0110s0100blm18p-3081632.pdf?src-supplier=Avnet; ComponentLink13URL: https://datasheet.ciiva.com/41449/001172297-da-01-en-drossel-0603-120r-1-6x0-8mm-4000st-41449659.pdf?src-supplier=Conrad; ComponentLink13Description: https://datasheet.ciiva.com/41449/001172297-da-01-en-drossel-0603-120r-1-6x0-8mm-4000st-41449659.pdf?src-supplier=Conrad
J2 = X6511WV-02H-C60D30: Gold 250V 3A Straight Square Pins 2.5mm 2P 260℃ 6mm -40℃~+105℃ 3mm 2.54mm Plugin Black Brass 1x2P Plugin,P=2.54mm Pin Headers ROHS; Manufacturer: XKB; Item Type: Male Header; Manufacturer Part Number: X6511WV-02H-C60D30; Package: Plugin,P=2.54mm; LCSC Part Number: C706874; ComponentLink1Description: LCSC; ComponentLink1URL: https://www.lcsc.com/product-detail/Pin-Headers_XKB-Connectivity-X6511WV-02H-C60D30_C706874.html
J3 = CR2032-BS-6-1: Battery base CR2032 SMD Battery Connectors ROHS; Manufacturer: Q&J; Manufacturer Part Number: CR2032-BS-6-1; LCSC Part Number: C70377; Item Type: Connector; ComponentLink1Description: LCSC; ComponentLink1URL: https://www.lcsc.com/product-detail/Battery-Connectors_Q-J-CR2032-BS-6-1_C70377.html
L4-L8 = YHNR3012-R47M: 4.2A 470nH 合金磁胶电感 ±20% 8A SMD,3x3mm Power Inductors ROHS; Manufacturer: YJYCOIN; Manufacturer Part Number: YHNR3012-R47M; Package: SMD,3x3mm; LCSC Part Number: C20416183; Item Type: Inductor; ComponentLink1Description: LCSC; ComponentLink1URL: https://www.lcsc.com/product-detail/Power-Inductors_YJYCOIN-YHNR3012-R47M_C20416183.html
P6-P9 = TEST POINT 0.5mm Dia: Test Point ON; Item Type: Test Point; Manufacturer Part Number: TEST POINT 0.5mm Dia
R17 R23 R30 R31 = RC0402FR-0710KL: RES 10K OHM 1% 1/16W 0402; Manufacturer: Yageo; Resistance: 10kR; Voltage Rating (DC): 50V; Temperature Coefficient: 100ppm/°C; Power Rating: 62.5mW; Max Power Dissipation: 63mW; Item Type: Resistor; Supplier 1: Mouser; Manufacturer Part Number: RC0402FR-0710KL; RoHS: Yes; Category: Chip SMD Resistors; Stock 1: 18648329; Pricing 1: 1=0.10000, 10=0.01400, 50=0.01400, 100=0.00500, 1000=0.00300, 10000=0.00200 (USD); Case/Package: 0402; Number of Pins: 2; Case Code (Imperial): 0402; Case Code (Metric): 1005; Min Operating Temperature: -55°C; Max Operating Temperature: 155°C; Resistor Type: Thick Film; Tolerance: 1%; Packaging: Tape and Reel; Voltage Rating: 50V; Termination: SMD/SMT; Working Voltage: 50V; Number of Terminations: 2; Features: Moisture Resistant; Series: RC; Resistance Tolerance: 1%; Construction: Rectangular; Length: 1mm; Width: 0.5mm; Height: 0.32mm; Depth: 0.5mm; Lead Pitch: 0.2mm; REACH SVHC: No SVHC; Lead Free: Lead Free; RoHS Compliant: Yes; Military Standard: Not; ComponentLink1URL: https://datasheet.ciiva.com/7660/38568-7660787.pdf?src-supplier=Element14; ComponentLink1Description: https://datasheet.ciiva.com/7660/38568-7660787.pdf?src-supplier=Element14; ComponentLink2URL: https://datasheet.ciiva.com/7849/1686128-7849814.pdf?src-supplier=Element14; ComponentLink2Description: https://datasheet.ciiva.com/7849/1686128-7849814.pdf?src-supplier=Element14; ComponentLink3URL: https://datasheet.ciiva.com/7983/1018594-7983486.pdf?src-supplier=Element14; ComponentLink3Description: https://datasheet.ciiva.com/7983/1018594-7983486.pdf?src-supplier=Element14; ComponentLink4URL: https://datasheet.ciiva.com/22747/1018594-22747512.pdf?src-supplier=Element14; ComponentLink4Description: https://datasheet.ciiva.com/22747/1018594-22747512.pdf?src-supplier=Element14; ComponentLink5URL: https://datasheet.ciiva.com/12667/pyu-rc0402-51-rohs-l-6-r-12667067.pdf?src-supplier=Mouser; ComponentLink5Description: https://datasheet.ciiva.com/12667/pyu-rc0402-51-rohs-l-6-r-12667067.pdf?src-supplier=Mouser; ComponentLink6URL: https://datasheet.ciiva.com/7849/1784430-7849813.pdf?src-supplier=Element14; ComponentLink6Description: https://datasheet.ciiva.com/7849/1784430-7849813.pdf?src-supplier=Element14; ComponentLink7URL: https://datasheet.ciiva.com/7849/1784430-7849815.pdf?src-supplier=Element14; ComponentLink7Description: https://datasheet.ciiva.com/7849/1784430-7849815.pdf?src-supplier=Element14; Supplier Part Number 1: 603-RC0402FR-0710KL; LCSC Part Number: C60490
R18 R19 R29 R32 = RC0402FR-07100RL: RES 100 OHM 1% 1/16W 0402; Manufacturer: Yageo; Power Rating: 62.5mW; Voltage Rating: 50V; Temperature Coefficient: 100ppm/°C; Max Power Dissipation: 63mW; Item Type: Resistor; Supplier 1: Mouser; Manufacturer Part Number: RC0402FR-07100RL; RoHS: Yes; Category: Chip SMD Resistors; Stock 1: 699545; Pricing 1: 1=0.10000, 10=0.01200, 50=0.01200, 100=0.00500, 1000=0.00300, 2500=0.00200, 10000=0.00100 (USD); Case/Package: 0402; Number of Pins: 2; Case Code (Imperial): 0402; Case Code (Metric): 1005; Size Code: 0402; Min Operating Temperature: -55°C; Max Operating Temperature: 155°C; Tolerance: 1%; Voltage Rating (DC): 50V; Resistance: 100R; Packaging: Tape and Reel; Termination: SMD/SMT; Resistor Type: Thick Film; Features: Moisture Resistant; Series: RC; Number of Terminations: 2; Resistance Tolerance: 1%; Construction: Rectangular; Technology: THICK FILM; Length: 1mm; Width: 0.5mm; Height: 0.32mm; Depth: 0.5mm; RoHS Compliant: Yes; REACH SVHC: No SVHC; Military Standard: Not; Lead Free: Lead Free; ComponentLink1URL: https://datasheet.ciiva.com/11808/0900766b80c66297-11808765.pdf?src-supplier=RSComponents; ComponentLink1Description: https://datasheet.ciiva.com/11808/0900766b80c66297-11808765.pdf?src-supplier=RSComponents; ComponentLink2URL: https://datasheet.ciiva.com/7849/1784430-7849810.pdf?src-supplier=Element14; ComponentLink2Description: https://datasheet.ciiva.com/7849/1784430-7849810.pdf?src-supplier=Element14; ComponentLink3URL: https://datasheet.ciiva.com/28367/1018594-28367226.pdf?src-supplier=Element14; ComponentLink3Description: https://datasheet.ciiva.com/28367/1018594-28367226.pdf?src-supplier=Element14; ComponentLink4URL: https://datasheet.ciiva.com/22747/1018594-22747511.pdf?src-supplier=Element14; ComponentLink4Description: https://datasheet.ciiva.com/22747/1018594-22747511.pdf?src-supplier=Element14; ComponentLink5URL: https://datasheet.ciiva.com/12667/pyu-rc0402-51-rohs-l-6-r-12667957.pdf?src-supplier=Mouser; ComponentLink5Description: https://datasheet.ciiva.com/12667/pyu-rc0402-51-rohs-l-6-r-12667957.pdf?src-supplier=Mouser; ComponentLink6URL: https://datasheet.ciiva.com/15189/getdatasheetpartid-329466-15189335.pdf?src-supplier=Verical; ComponentLink6Description: https://datasheet.ciiva.com/15189/getdatasheetpartid-329466-15189335.pdf?src-supplier=Verical; ComponentLink7URL: https://datasheet.ciiva.com/16740/pyu-rc0402-51-rohs-l-6-r-16740566.pdf?src-supplier=Future+Electronics; ComponentLink7Description: https://datasheet.ciiva.com/16740/pyu-rc0402-51-rohs-l-6-r-16740566.pdf?src-supplier=Future+Electronics; Supplier Part Number 1: 603-RC0402FR-07100RL; LCSC Part Number: C106232
R20 = RC0402FR-07560RL: RES 560 OHM 1% 1/16W 0402; Manufacturer: Yageo; Power Rating: 63mW; Temperature Coefficient: 100ppm/°C; Voltage Rating: 50V; Item Type: Resistor; Supplier: Future Electronics; Supplier Part Number: 8872046; Manufacturer Part Number: RC0402FR-07560RL; RoHS: Yes; Category: Chip SMD Resistors; Stock: 1360000; Pricing: 10000=0.0012, 100000=0.0011, 300000=0.0011, 1250000=0.001, 3000000=0.0009 (USD); Case/Package: 0402; Case Code (Metric): 1005; Case Code (Imperial): 0402; Min Operating Temperature: -55°C; Max Operating Temperature: 155°C; Tolerance: 1%; Packaging: Tape and Reel; Value: 560R; Package Quantity: 1; Resistor Type: Thick Film; Number of Terminations: 2; Termination: SMD/SMT; Max Power Dissipation: 63mW; Features: Moisture Resistant; Series: RC; Construction: Rectangular; Resistance Tolerance: 1%; Length: 1mm; Width: 0.02inch; Height: 0.016inch; Depth: 0.5mm; RoHS Compliant: Yes; Military Standard: Not; Lead Free: Lead Free; Reach SVHC Compliant: Unknown; ComponentLink1URL: https://datasheet.ciiva.com/2453/pyu-r-int-thick-7-2453458.pdf?src-supplier=Digikey; ComponentLink1Description: https://datasheet.ciiva.com/2453/pyu-r-int-thick-7-2453458.pdf?src-supplier=Digikey; ComponentLink2URL: https://datasheet.ciiva.com/2453/pyu-r-int-thick-7-2453459.pdf?src-supplier=Digikey; ComponentLink2Description: https://datasheet.ciiva.com/2453/pyu-r-int-thick-7-2453459.pdf?src-supplier=Digikey; ComponentLink3URL: https://datasheet.ciiva.com/2453/pyu-r-int-thick-7-2453457.pdf?src-supplier=Digikey; ComponentLink3Description: https://datasheet.ciiva.com/2453/pyu-r-int-thick-7-2453457.pdf?src-supplier=Digikey; ComponentLink4URL: https://datasheet.ciiva.com/12558/pyu-rc0402-51-rohs-l-6-r-8721-12558383.pdf?src-supplier=Mouser; ComponentLink4Description: https://datasheet.ciiva.com/12558/pyu-rc0402-51-rohs-l-6-r-8721-12558383.pdf?src-supplier=Mouser; ComponentLink5URL: https://datasheet.ciiva.com/7850/1018594-7850042.pdf?src-supplier=Element14; ComponentLink5Description: https://datasheet.ciiva.com/7850/1018594-7850042.pdf?src-supplier=Element14; ComponentLink6URL: https://datasheet.ciiva.com/7850/1018594-7850043.pdf?src-supplier=Element14; ComponentLink6Description: https://datasheet.ciiva.com/7850/1018594-7850043.pdf?src-supplier=Element14; LCSC Part Number: C163460
R21 = RC0402FR-079K1L: RES 9.1K OHM 1% 1/16W 0402; Manufacturer: Yageo; Value: 9.1kR; Temperature Coefficient: 100ppm/°C; Power Rating: 63mW; Voltage Rating: 50V; Item Type: Resistor; Supplier: Future Electronics; Supplier Part Number: 8081614; Manufacturer Part Number: RC0402FR-079K1L; RoHS: Yes; Category: Chip SMD Resistors; Stock: 70000; Pricing: 10000=0.0012, 100000=0.0011, 300000=0.001, 750000=0.001, 2000000=0.0009 (USD); Case/Package: 0402; Contact Plating: Tin,Matte; Case Code (Imperial): 0402; Case Code (Metric): 1005; Min Operating Temperature: -55°C; Max Operating Temperature: 155°C; Tolerance: 1%; Resistor Type: Thick Film; Package Quantity: 1; Packaging: Tape and Reel; Termination: SMD/SMT; Number of Terminations: 2; Max Power Dissipation: 63mW; Features: Moisture Resistant; Series: RC; Construction: Rectangular; Resistance Tolerance: 1%; Voltage Rating (DC): 50V; Length: 1mm; Width: 0.02inch; Height: 0.016inch; Depth: 0.5mm; Military Standard: Not; RoHS Compliant: Yes; Reach SVHC Compliant: Unknown; Lead Free: 5697LeadFree; ComponentLink1URL: https://datasheet.ciiva.com/7850/1018594-7850124.pdf?src-supplier=Element14; ComponentLink1Description: https://datasheet.ciiva.com/7850/1018594-7850124.pdf?src-supplier=Element14; ComponentLink2URL: https://datasheet.ciiva.com/7850/1018594-7850123.pdf?src-supplier=Element14; ComponentLink2Description: https://datasheet.ciiva.com/7850/1018594-7850123.pdf?src-supplier=Element14; ComponentLink3URL: https://datasheet.ciiva.com/2491/pyu-r-int-thick-7-2491238.pdf?src-supplier=Digikey; ComponentLink3Description: https://datasheet.ciiva.com/2491/pyu-r-int-thick-7-2491238.pdf?src-supplier=Digikey; ComponentLink4URL: https://datasheet.ciiva.com/2491/pyu-r-int-thick-7-2491239.pdf?src-supplier=Digikey; ComponentLink4Description: https://datasheet.ciiva.com/2491/pyu-r-int-thick-7-2491239.pdf?src-supplier=Digikey; ComponentLink5URL: https://datasheet.ciiva.com/8891/pyu-rc0402-51-rohs-l-6-8891518.pdf?src-supplier=Avnet; ComponentLink5Description: https://datasheet.ciiva.com/8891/pyu-rc0402-51-rohs-l-6-8891518.pdf?src-supplier=Avnet; ComponentLink6URL: https://datasheet.ciiva.com/17068/pyu-rc0402-51-rohs-l-6-r-17068454.pdf?src-supplier=Future+Electronics; ComponentLink6Description: https://datasheet.ciiva.com/17068/pyu-rc0402-51-rohs-l-6-r-17068454.pdf?src-supplier=Future+Electronics; ComponentLink7URL: https://datasheet.ciiva.com/2491/pyu-r-int-thick-7-2491237.pdf?src-supplier=Digikey; ComponentLink7Description: https://datasheet.ciiva.com/2491/pyu-r-int-thick-7-2491237.pdf?src-supplier=Digikey; LCSC Part Number: C163450
R22 R24-R26 = RC0402FR-0722RL: RES 22 OHM 1% 1/16W 0402; Manufacturer: Yageo; Voltage Rating: 50V; Power Rating: 62.5mW; Temperature Coefficient: 100ppm/°C; Max Power Dissipation: 63mW; Item Type: Resistor; Supplier 1: Avnet; Manufacturer Part Number: RC0402FR-0722RL; RoHS: Yes; Category: Chip SMD Resistors; Stock 1: 1810000; Pricing 1: 10000=0.00085 (USD); Case/Package: 0402; Number of Pins: 2; Case Code (Imperial): 0402; Case Code (Metric): 1005; Size Code: 0402; Min Operating Temperature: -55°C; Max Operating Temperature: 155°C; Resistor Type: Thick Film; Voltage Rating (DC): 50V; Resistance: 22R; Tolerance: 1%; Packaging: Tape and Reel; Termination: SMD/SMT; Features: Moisture Resistant; Series: RC; Number of Terminations: 2; Resistance Tolerance: 1%; Technology: THICK FILM; Construction: Rectangular; Length: 1mm; Width: 0.5mm; Height: 0.32mm; Depth: 0.5mm; RoHS Compliant: Yes; Reach SVHC Compliant: Yes; Military Standard: Not; Lead Free: Lead Free; ComponentLink1URL: https://datasheet.ciiva.com/11819/0900766b80c66297-11819462.pdf?src-supplier=RSComponents; ComponentLink1Description: https://datasheet.ciiva.com/11819/0900766b80c66297-11819462.pdf?src-supplier=RSComponents; ComponentLink2URL: https://datasheet.ciiva.com/7849/1018594-7849912.pdf?src-supplier=Element14; ComponentLink2Description: https://datasheet.ciiva.com/7849/1018594-7849912.pdf?src-supplier=Element14; ComponentLink3URL: https://datasheet.ciiva.com/7849/1018594-7849911.pdf?src-supplier=Element14; ComponentLink3Description: https://datasheet.ciiva.com/7849/1018594-7849911.pdf?src-supplier=Element14; ComponentLink4URL: https://datasheet.ciiva.com/16930/pyu-rc0402-51-rohs-l-6-r-16930687.pdf?src-supplier=Future+Electronics; ComponentLink4Description: https://datasheet.ciiva.com/16930/pyu-rc0402-51-rohs-l-6-r-16930687.pdf?src-supplier=Future+Electronics; ComponentLink5URL: https://datasheet.ciiva.com/26829/getdatasheetpartid-554995-26829991.pdf?src-supplier=Verical; ComponentLink5Description: https://datasheet.ciiva.com/26829/getdatasheetpartid-554995-26829991.pdf?src-supplier=Verical; Supplier Part Number 1: RC0402FR-0722RL; LCSC Part Number: C114765
R27 = AT0402BRD0751KL: RES 51K OHM 0.1% 1/16W 0402; Manufacturer: Yageo; Item Type: Resistor; Supplier: Digikey; Supplier Part Number: 13-AT0402BRD0751KLTR-ND; Manufacturer Part Number: AT0402BRD0751KL; RoHS: Yes; Pricing: 10000=0.08359 (USD); LCSC Part Number: C5455493
R28 = RT0402BRD07120KL: RES SMD 120K OHM 0.1% 1/16W 0402; Manufacturer: Yageo; Item Type: Resistor; Supplier: Future Electronics; Supplier Part Number: 4117142; Manufacturer Part Number: RT0402BRD07120KL; RoHS: Yes; Category: Chip SMD Resistors; Stock: 10000; Pricing: 10000=0.0243, 20000=0.0238, 40000=0.0232, 50000=0.023, 150000=0.022 (USD); ComponentLink1URL: https://datasheet.ciiva.com/12724/pyu-rt-1-to-0-05-rohs-l-4-12724453.pdf?src-supplier=Mouser; ComponentLink1Description: https://datasheet.ciiva.com/12724/pyu-rt-1-to-0-05-rohs-l-4-12724453.pdf?src-supplier=Mouser; LCSC Part Number: C852501
R33 = RC0402FR-070RL: RES 0 OHM JUMPER 1/16W 0402; Manufacturer: Yageo; Tolerance: 1%; Power Rating: 62.5mW; Voltage Rating: 50V; Temperature Coefficient: 200ppm/°C; Max Power Dissipation: 63mW; Supplier 1: Mouser; Manufacturer Part Number: RC0402FR-070RL; RoHS: Yes; Category: Chip SMD Resistors; Stock 1: 8556842; Pricing 1: 1=0.10000, 10=0.01400, 50=0.01400, 100=0.00600, 1000=0.00300, 5000=0.00200, 10000=0.00100 (USD); Mount: Surface Mount; Case/Package: 0402; Contact Plating: Tin,Matte; Case Code (Imperial): 0402; Case Code (Metric): 1005; Size Code: 0402; Min Operating Temperature: -55°C; Max Operating Temperature: 155°C; Resistance: 0R; Resistor Type: Thick Film; Packaging: Tape and Reel; Termination: SMD/SMT; Features: Moisture Resistant; Series: RC; Number of Terminations: 2; Length: 1mm; Width: 0.5mm; Height: 0.35mm; Radiation Hardening: No; Lead Free: Lead Free; RoHS Compliant: Yes; ComponentLink1URL: https://datasheet.ciiva.com/8896/pyu-rc0402-51-rohs-l-6-8896149.pdf?src-supplier=Avnet; ComponentLink1Description: https://datasheet.ciiva.com/8896/pyu-rc0402-51-rohs-l-6-8896149.pdf?src-supplier=Avnet; ComponentLink2URL: https://datasheet.ciiva.com/16790/pyu-rc0402-51-rohs-l-6-r-16790444.pdf?src-supplier=Future+Electronics; ComponentLink2Description: https://datasheet.ciiva.com/16790/pyu-rc0402-51-rohs-l-6-r-16790444.pdf?src-supplier=Future+Electronics; Supplier Part Number 1: 603-RC0402FR-070RL; LCSC Part Number: C106231
SB1 = Solder Bridge 0402: Solder Bridge ON; Manufacturer Part Number: Solder Bridge 0402; Item Type: Solder Bridge
SW1 SW2 = B3U-1000P: SWITCH TACTILE SPST-NO 0.05A 12V; Manufacturer: Omron; Mechanical Life: 200000Cycles; Operating Force: 1.5N; Throw Configuration: SPST; Current Rating: 50mA; Contact Resistance: 100mR; Illumination Type: Non-Illuminated,Illuminated; Switch Travel: 0.15mm; Switch Function: Off-Mom; Actuator Type: Standard; Actuator Length: 0.4mm; Ratings: Dust Proof,IP40; ComponentLink1URL: http://www.farnell.com/datasheets/60838.pdf?src-supplier=Farnell; ComponentLink1Description: http://www.farnell.com/datasheets/60838.pdf?src-supplier=Farnell; ComponentLink2URL: http://www.farnell.com/datasheets/60838.pdf?src-supplier=Element14; ComponentLink2Description: http://www.farnell.com/datasheets/60838.pdf?src-supplier=Element14; ComponentLink3URL: https://omronfs.omron.com/en_US/ecb/products/pdf/en-b3u.pdf?src-supplier=Digi-Key; ComponentLink3Description: https://omronfs.omron.com/en_US/ecb/products/pdf/en-b3u.pdf?src-supplier=Digi-Key; ComponentLink4URL: http://www.omron.com/ecb/products/pdf/en-b3u.pdf?src-supplier=Digi-Key; ComponentLink4Description: http://www.omron.com/ecb/products/pdf/en-b3u.pdf?src-supplier=Digi-Key; ComponentLink5URL: https://www.distrelec.biz/Web/Downloads/he/et/B3U_eng_datasheet.pdf?mime=application%2Fpdf&src-supplier=Distrelec; ComponentLink5Description: https://www.distrelec.biz/Web/Downloads/he/et/B3U_eng_datasheet.pdf?mime=application%2Fpdf&src-supplier=Distrelec; ComponentLink6URL: http://www.onlinecomponents.com/productFiles/mf-OM/en-b3u.pdf?src-supplier=Onlinecomponents.com; ComponentLink6Description: http://www.onlinecomponents.com/productFiles/mf-OM/en-b3u.pdf?src-supplier=Onlinecomponents.com; Supplier 1: Digi-Key; Manufacturer Part Number: B3U-1000P; Stock 1: 116454; Pricing 1: 1=1, 10=0.961, 25=0.9064, 50=0.7976, 100=0.7251, 250=0.68888, 500=0.67074, 1000=0.52571 (USD); Mount: Surface Mount; Weight: 0.000776oz; Contact Material: Silver; Min Operating Temperature: -25°C; Max Operating Temperature: 70°C; Packaging: Tape and Reel; Voltage Rating (DC): 12V; Package Quantity: 1; Max Current Rating: 50mA; Termination: SMD/SMT; Orientation: Straight; Max Voltage Rating (DC): 12V; Electrical Life: 200000Cycles; Insulation Resistance: 100MR; Contact Current Rating: 50mA; Length: 4mm; Height: 1.2mm; Depth: 2.5mm; Width: 3mm; REACH SVHC: Unknown; Lead Free: Lead Free; ComponentLink7URL: https://www.verical.com/server-webapp/html/getDatasheet?partID=552554&src-supplier=Verical; ComponentLink7Description: https://www.verical.com/server-webapp/html/getDatasheet?partID=552554&src-supplier=Verical; ComponentLink8URL: http://www.farnell.com/datasheets/1685550.pdf?src-supplier=Element14; ComponentLink8Description: http://www.farnell.com/datasheets/1685550.pdf?src-supplier=Element14; ComponentLink9URL: http://www.farnell.com/datasheets/2610940.pdf?src-supplier=Farnell; ComponentLink9Description: http://www.farnell.com/datasheets/2610940.pdf?src-supplier=Farnell; ComponentLink10URL: https://www.alliedelec.com/m/d/4c8a9ef82804fc3c241a13c1e298fd73.pdf?src-supplier=Allied+Electronics; ComponentLink10Description: https://www.alliedelec.com/m/d/4c8a9ef82804fc3c241a13c1e298fd73.pdf?src-supplier=Allied+Electronics; Supplier Part Number 1: SW1020DKR-ND; LCSC Part Number: C231329; Item Type: Switch
U6 = RK809-5: QFN-68-EP(7x7) Power Management Specialized - PMIC ROHS; Manufacturer: Rockchip; Item Type: IC; Manufacturer Part Number: RK809-5; Package: QFN-68-EP(7x7); LCSC Part Number: C2939628; ComponentLink1Description: LCSC; ComponentLink1URL: https://www.lcsc.com/product-detail/Power-Management-Specialized-PMIC_Rockchip-RK809-5_C2939628.html
X1 = XDMCZLNDDF-0.032768MHZ: 32.768kHz 贴片晶振 12.5pF ±20ppm ±20ppm SMD3215-2P Crystals ROHS; Manufacturer: TAITIEN Elec; Manufacturer Part Number: XDMCZLNDDF-0.032768MHZ; Package: SMD3215-2P; LCSC Part Number: C521573; Item Type: Crystal; ComponentLink1Description: LCSC; ComponentLink1URL: https://www.lcsc.com/product-detail/Crystals_TAITIEN-Elec-XDMCZLNDDF-0-032768MHZ_C521573.html